# Altium project MicroMMC_SM_v3.PrjPcb
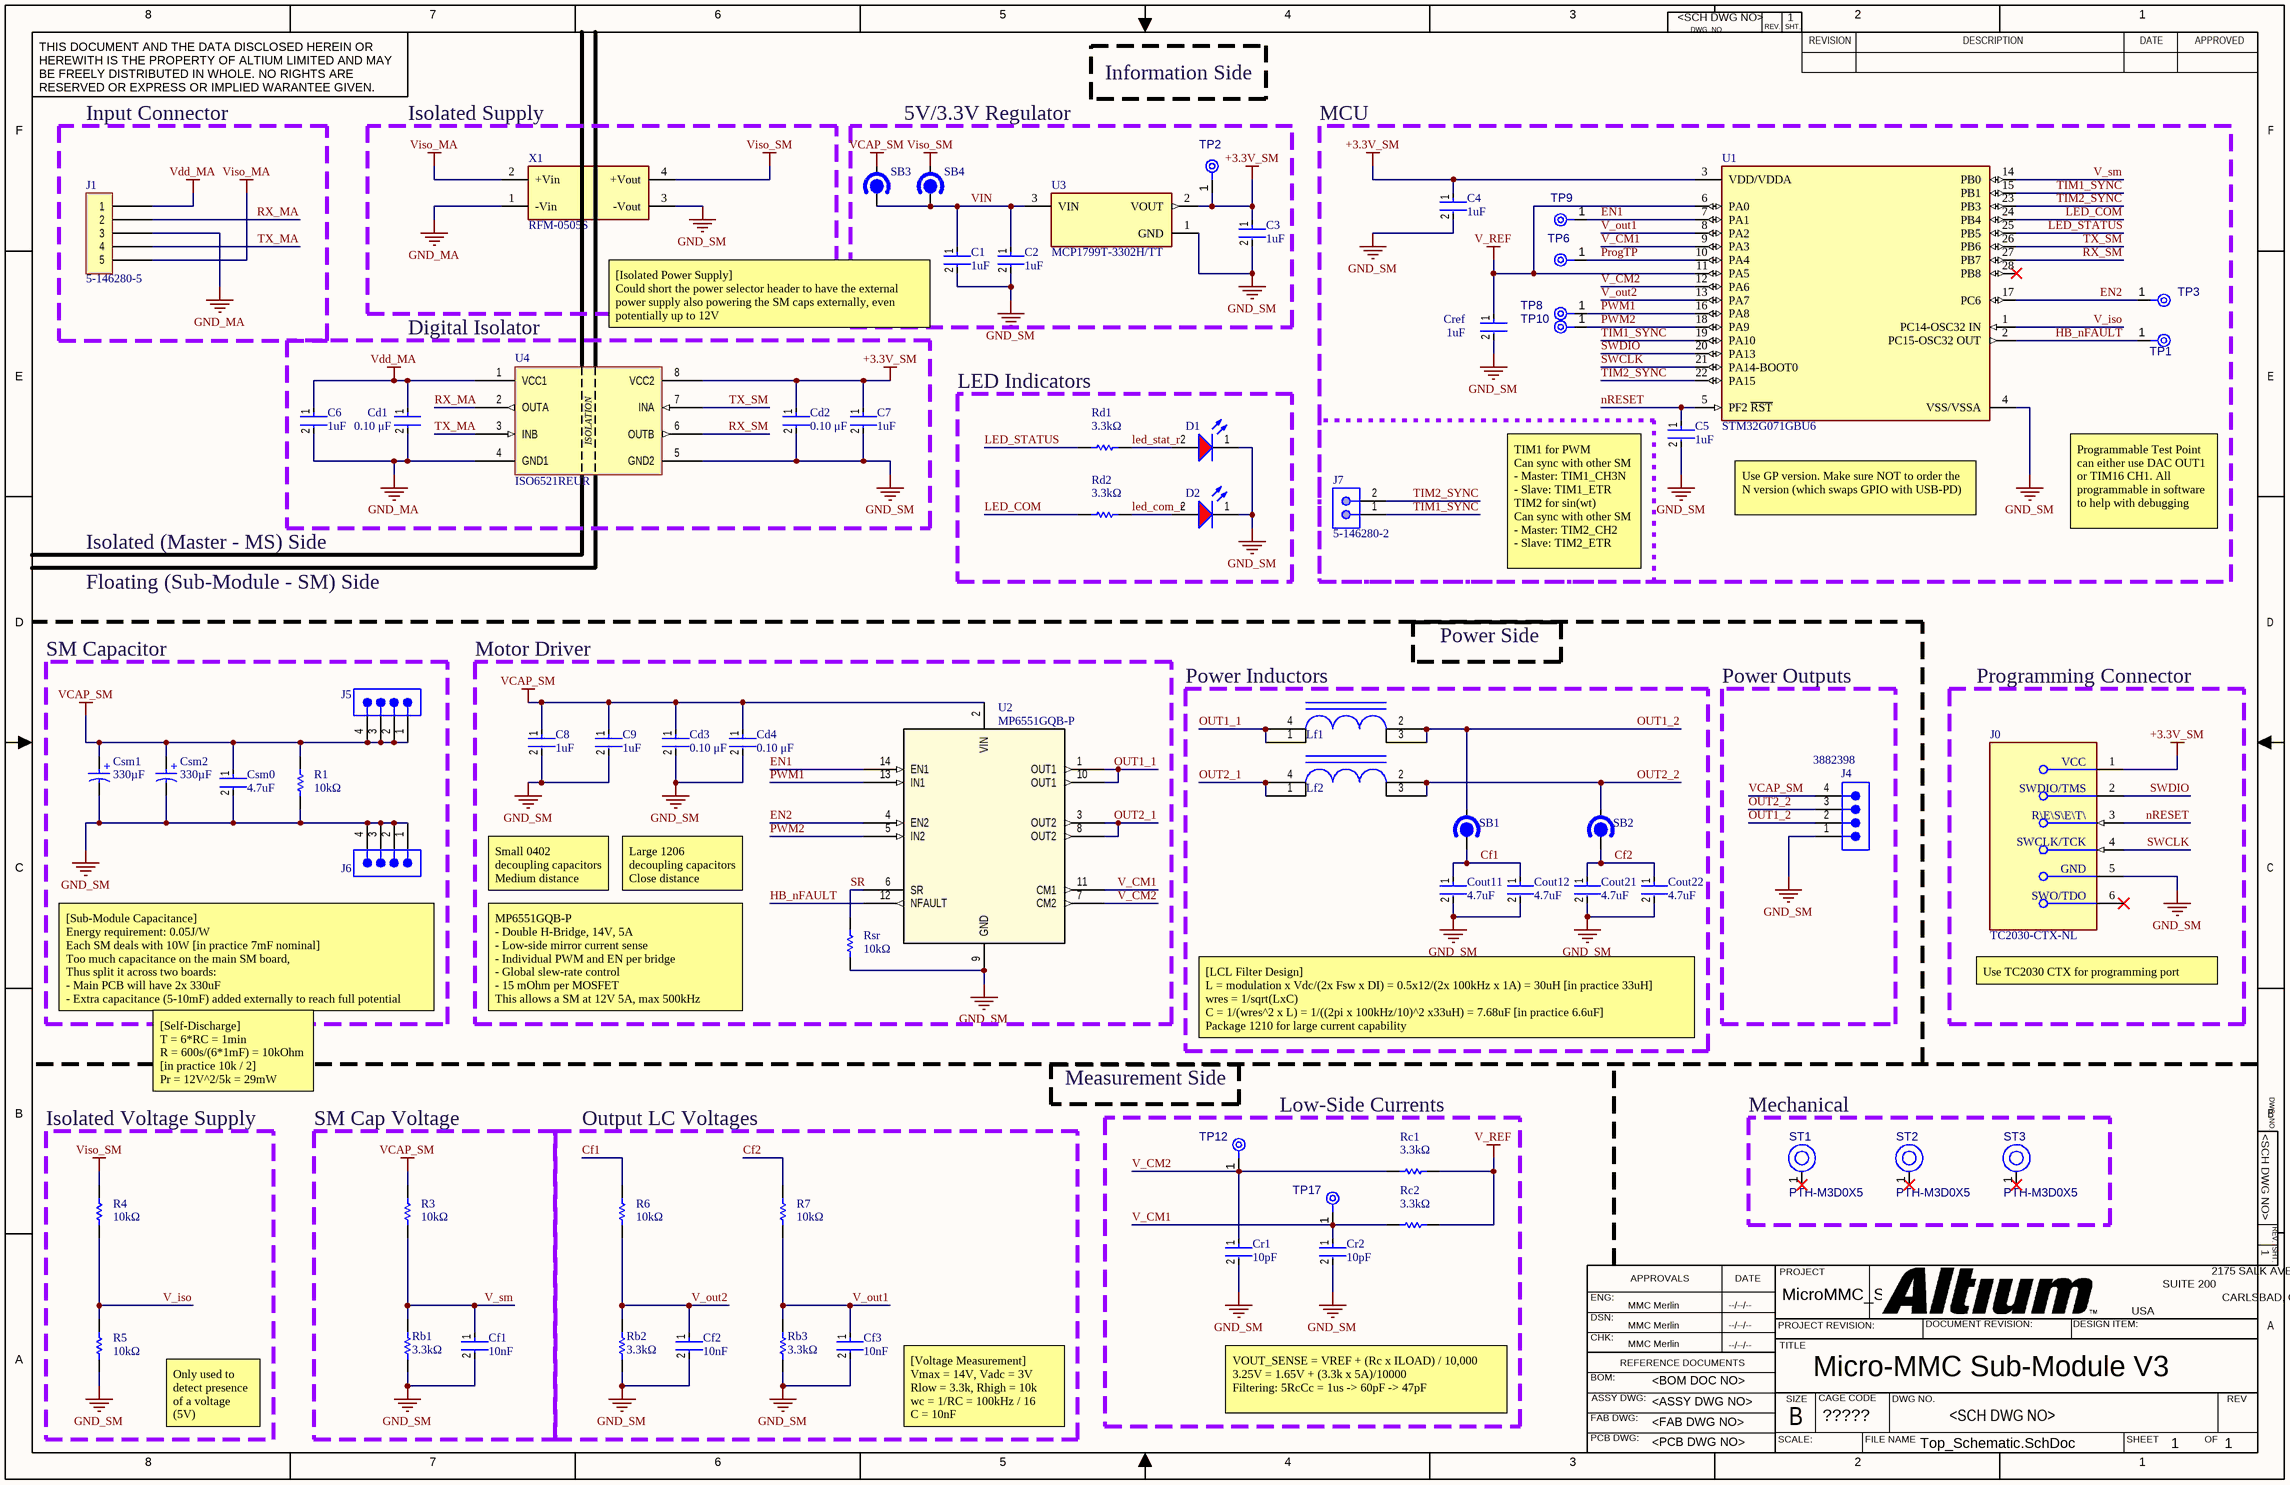
[diagram p0: Top_Schematic.SchDoc]
CAGE_CODE: ?????; CONTRACT_NUMBER: <CONTRACT NO>; DOC_NO_ASSY_DWG: <ASSY DWG NO>; DOC_NO_BOM: <BOM DOC NO>; DOC_NO_FAB_DWG: <FAB DWG NO>; DOC_NO_SCH_DWG: <SCH DWG NO>; PCB_2_DEC_TOL: +/-.01; PCB_3_DEC_TOL: +/-.010; PCB_ANG_TOL: +/-1/2; PCB_ASSEMBLY_NO: <PCB ASSY NO>; PCB_CHECKER: - -----; PCB_CHECKER_APP_DATE: --/--/----; PCB_DESIGNER: - -----; PCB_DESIGNER_APP_DATE: --/--/----; PCB_DWG_NO: <PCB DWG NO>; PCB_ENGINEER: - -----; PCB_ENGINEER_APP_DATE: --/--/----; PCB_PART_NUMBER: <PCB PN>; PCB_REV: A; SCH_REV: A
1 sheet, 71 parts. Net scope: global (net labels, ports and power ports of the same name join across sheets).
Board file: MicroMMC_SM_v3.PcbDoc

## Sheet Top_Schematic.SchDoc: Micro-MMC Sub-Module V3
size 431 x 279 mm; Date: 10/08/2023; ApprovedBy: MMC Merlin; CheckedBy: MMC Merlin; Author: MMC Merlin; CompanyName: University of Edinburgh; DrawnBy: MMC Merlin; Engineer: MMC Merlin; Organization: University of Edinburgh; Address1: School of Engineering; Address2: King's Buildings Campus; Address3: Edinburgh EH9 5FB; Address4: UK; DocumentNumber: 1; SheetNumber: 1; SheetTotal: 1; Project: MicroMMC_SM_V3; ENG_APP_DATE: --/--/--; DSN_APP_DATE: --/--/--; CHK_APP_DATE: --/--/--; SPICEModelCacheCJHNTGTK: <root> / <DocumentId>CJHNTGTK</DocumentId> / </root>; Time: 20:45

### Parts
C1  Capacitance: 1uF  [FP-GRM155-0_05-IPC_C]  (hidden comment: GRM155R61E105KA12D)
C2  Capacitance: 1uF  [FP-GRM155-0_05-IPC_C]  (hidden comment: GRM155R61E105KA12D)
C3  Capacitance: 1uF  [FP-GRM155-0_05-IPC_C]  (hidden comment: GRM155R61E105KA12D)
C4  Capacitance: 1uF  [FP-GRM155-0_05-IPC_C]  (hidden comment: GRM155R61E105KA12D)
C5  Capacitance: 1uF  [FP-GRM155-0_05-IPC_C]  (hidden comment: GRM155R61E105KA12D)
C6  Capacitance: 1uF  [FP-GRM155-0_05-IPC_C]  (hidden comment: GRM155R61E105KA12D)
C7  Capacitance: 1uF  [FP-GRM155-0_05-IPC_C]  (hidden comment: GRM155R61E105KA12D)
C8  Capacitance: 1uF  [FP-GRM155-0_05-IPC_C]  (hidden comment: GRM155R61E105KA12D)
C9  Capacitance: 1uF  [FP-GRM155-0_05-IPC_C]  (hidden comment: GRM155R61E105KA12D)
Cd1  Capacitance: 0.10 μF  [FP-C1206C-EB-MFG]  (hidden comment: C1206C104M5RACTU)
Cd2  Capacitance: 0.10 μF  [FP-C1206C-EB-MFG]  (hidden comment: C1206C104M5RACTU)
Cd3  Capacitance: 0.10 μF  [FP-C1206C-EB-MFG]  (hidden comment: C1206C104M5RACTU)
Cd4  Capacitance: 0.10 μF  [FP-C1206C-EB-MFG]  (hidden comment: C1206C104M5RACTU)
Cf1  Capacitance: 10nF  [FP-CL165-IPC_C]  (hidden comment: CL05B103KB5NNNC)
Cf2  Capacitance: 10nF  [FP-CL165-IPC_C]  (hidden comment: CL05B103KB5NNNC)
Cf3  Capacitance: 10nF  [FP-CL165-IPC_C]  (hidden comment: CL05B103KB5NNNC)
Cout11  Capacitance: 4.7uF  [FP-GRM21B-0_15-IPC_C]  (hidden comment: GRM21BR61H475ME51L)
Cout12  Capacitance: 4.7uF  [FP-GRM21B-0_15-IPC_C]  (hidden comment: GRM21BR61H475ME51L)
Cout21  Capacitance: 4.7uF  [FP-GRM21B-0_15-IPC_C]  (hidden comment: GRM21BR61H475ME51L)
Cout22  Capacitance: 4.7uF  [FP-GRM21B-0_15-IPC_C]  (hidden comment: GRM21BR61H475ME51L)
Cr1  Capacitance: 10pF  [FP-GJM155-0_05-MFG]  (hidden comment: GJM1555C1H100JB01D)
Cr2  Capacitance: 10pF  [FP-GJM155-0_05-MFG]  (hidden comment: GJM1555C1H100JB01D)
Cref  Capacitance: 1uF  [FP-GRM155-0_05-IPC_C]  (hidden comment: GRM155R61E105KA12D)
Csm0  Capacitance: 4.7uF  [FP-GRM21B-0_15-IPC_C]  (hidden comment: GRM21BR61H475ME51L)
Csm1  Capacitance: 330µF  [WCAP-ATG8_D8H11.5]  (hidden comment: 860010474012)
Csm2  Capacitance: 330µF  [WCAP-ATG8_D8H11.5]  (hidden comment: 860010474012)
D1  150060RS75000  [WL-SMCW_0603_150060xx75000]  (value not drawn)
D2  150060RS75000  [WL-SMCW_0603_150060xx75000]  (value not drawn)
J0  TC2030-CTX-NL  [FP-TC2030-CTX-NL-MFG]  (no BOM)
J1  5-146280-5  [5-146280-5]  (no BOM)
J4  Supplier Part Number 1: 3882398  [SMTC-TSW-104-08-X-S]  (hidden comment: TSW-104-08-L-S)  (no BOM)
J5  TSW-104-08-L-S  [SMTC-TSW-104-08-X-S]  (value not drawn)  (no BOM)
J6  TSW-104-08-L-S  [SMTC-TSW-104-08-X-S]  (value not drawn)  (no BOM)
J7  5-146280-2  [TECO-5-146280-2_V]  (no BOM)
Lf1  RCH1216BNP-100M  [TH Inductor]  (value not drawn)
Lf2  RCH1216BNP-100M  [TH Inductor]  (value not drawn)
R1  Resistance: 10kΩ  [RESC1005X40X25LL05T10]  (hidden comment: RC0402FR-0710KL)
R3  Resistance: 10kΩ  [RESC1005X40X25LL05T10]  (hidden comment: RC0402FR-0710KL)
R4  Resistance: 10kΩ  [RESC1005X40X25LL05T10]  (hidden comment: RC0402FR-0710KL)
R5  Resistance: 10kΩ  [RESC1005X40X25LL05T10]  (hidden comment: RC0402FR-0710KL)
R6  Resistance: 10kΩ  [RESC1005X40X25LL05T10]  (hidden comment: RC0402FR-0710KL)
R7  Resistance: 10kΩ  [RESC1005X40X25LL05T10]  (hidden comment: RC0402FR-0710KL)
Rb1  Resistance: 3.3kΩ  [RESC1005X40X25LL05T10]  (hidden comment: RC0402FR-073K3L)
Rb2  Resistance: 3.3kΩ  [RESC1005X40X25LL05T10]  (hidden comment: RC0402FR-073K3L)
Rb3  Resistance: 3.3kΩ  [RESC1005X40X25LL05T10]  (hidden comment: RC0402FR-073K3L)
Rc1  Resistance: 3.3kΩ  [RESC1005X40X25LL05T10]  (hidden comment: RC0402FR-073K3L)
Rc2  Resistance: 3.3kΩ  [RESC1005X40X25LL05T10]  (hidden comment: RC0402FR-073K3L)
Rd1  Resistance: 3.3kΩ  [RESC1005X40X25LL05T10]  (hidden comment: RC0402FR-073K3L)
Rd2  Resistance: 3.3kΩ  [RESC1005X40X25LL05T10]  (hidden comment: RC0402FR-073K3L)
Rsr  Resistance: 10kΩ  [RESC1005X40X25LL05T10]  (hidden comment: RC0402FR-0710KL)
SB1  Solder-Bridge-NO  [Solder-Bridge-NO-Footprint-1]  (value not drawn)  (no BOM)
SB2  Solder-Bridge-NO  [Solder-Bridge-NO-Footprint-1]  (value not drawn)  (no BOM)
SB3  Solder-Bridge-NO  [Solder-Bridge-NO-Footprint-1]  (value not drawn)  (no BOM)
SB4  Solder-Bridge-NO  [Solder-Bridge-NO-Footprint-1]  (value not drawn)  (no BOM)
ST1  PTH-M3D0X5  [PTH-M2D5X5]  (no BOM)
ST2  PTH-M3D0X5  [PTH-M2D5X5]  (no BOM)
ST3  PTH-M3D0X5  [PTH-M2D5X5]  (no BOM)
TP1  TPAD6R  [TP06R]  (value not drawn)  (no BOM)
TP2  TPAD6R  [TP06R]  (value not drawn)  (no BOM)
TP3  TPAD6R  [TP06R]  (value not drawn)  (no BOM)
TP6  TPAD6R  [TP06R]  (value not drawn)  (no BOM)
TP8  TPAD6R  [TP06R]  (value not drawn)  (no BOM)
TP9  TPAD6R  [TP06R]  (value not drawn)  (no BOM)
TP10  TPAD6R  [TP06R]  (value not drawn)  (no BOM)
TP12  TPAD6R  [TP06R]  (value not drawn)  (no BOM)
TP17  TPAD6R  [TP06R]  (value not drawn)  (no BOM)
U1  STM32G071GBU6  [FP-UFQFPN28-A0B0-MFG]
U2  MP6551GQB-P  [QFN-14_MP6551_MNP]
U3  MCP1799T-3302H/TT  [FP-C04-104-MFG]
U4  ISO6521REUR  [SON50P300X105-8N]
X1  RFM-0505S  [FP-RFM-0505S-MFG]

### Blocks framed on the sheet
Input Connector: J1
Isolated Supply: X1
5V/3.3V Regulator: C1-C3 SB3 SB4 TP2 U3
MCU: C4 C5 Cref J7 TP1 TP3 TP6 TP8-TP10 U1
Digital Isolator: C6 C7 Cd1 Cd2 U4
LED Indicators: D1 D2 Rd1 Rd2
SM Capacitor: Csm0-Csm2 J5 J6 R1
Motor Driver: C8 C9 Cd3 Cd4 Rsr U2
Power Inductors: Cout11 Cout12 Cout21 Cout22 Lf1 Lf2 SB1 SB2
Power Outputs: J4
Programming Connector: J0
Low-Side Currents: Cr1 Cr2 Rc1 Rc2 TP12 TP17
Mechanical: ST1-ST3
Isolated Voltage Supply: R4 R5
SM Cap Voltage: Cf1 R3 Rb1
Output LC Voltages: Cf2 Cf3 R6 R7 Rb2 Rb3

### Nets
+3.3V_SM: C3.1 C4.1 C7.1 Cd2.1 J0.1(VCC) TP2.1(TP) U1.3(VDD/VDDA) U3.2(VOUT) U4.8(VCC2)
GND_MA: C6.2 Cd1.2 J1.3 U4.4(GND1) X1.1(-Vin)
GND_SM: C1.2 C2.2 C3.2 C4.2 C5.2 C7.2 C8.2 C9.2 Cd2.2 Cd3.2 Cd4.2 Cf1.2 Cf2.2 Cf3.2 Cout11.2 Cout12.2 Cout21.2 Cout22.2 Cr1.2 Cr2.2 Cref.2 Csm0.2 Csm1.2(N) Csm2.2(N) D1.1(K) D2.1(K) J0.5(GND) J4.1 J6.1 J6.2 J6.3 J6.4 R1.1 R5.1 Rb1.1 Rb2.1 Rb3.1 Rsr.1 U1.4(VSS/VSSA) U2.9(GND) U3.1(GND) U4.5(GND2) X1.3(-Vout)
V_REF: Cref.1 Rc1.2 Rc2.2 U1.6(PA0) U1.11(PA5)
VCAP_SM: C8.1 C9.1 Cd3.1 Cd4.1 Csm0.1 Csm1.1(P) Csm2.1(P) J4.4 J5.1 J5.2 J5.3 J5.4 R1.2 R3.2 SB3.1 U2.2(VIN)
Vdd_MA: C6.1 Cd1.1 J1.1 U4.1(VCC1)
Viso_MA: J1.5 X1.2(+Vin)
Viso_SM: R4.2 SB4.1 X1.4(+Vout)
Cf1: Cout11.1 Cout12.1 R6.2 SB1.2
Cf2: Cout21.1 Cout22.1 R7.2 SB2.2
EN1: TP9.1(TP) U1.7(PA1) U2.14(EN1)
EN2: TP3.1(TP) U1.17(PC6) U2.4(EN2)
HB_nFAULT: TP1.1(TP) U1.2(PC15-OSC32_OUT) U2.12(NFAULT)
LED_COM: Rd2.1 U1.24(PB4)
led_com_r: D2.2(A) Rd2.2
led_stat_r: D1.2(A) Rd1.2
LED_STATUS: Rd1.1 U1.25(PB5)
nRESET: C5.1 J0.3(~{RESET}) U1.5(PF2_~{RST})
OUT1_1: Lf1.1 Lf1.4 U2.1(OUT1) U2.10(OUT1)
OUT1_2: J4.2 Lf1.2 Lf1.3 SB1.1
OUT2_1: Lf2.1 Lf2.4 U2.3(OUT2) U2.8(OUT2)
OUT2_2: J4.3 Lf2.2 Lf2.3 SB2.1
ProgTP: TP6.1(TP) U1.10(PA4)
PWM1: TP8.1(TP) U1.16(PA8) U2.13(IN1)
PWM2: TP10.1(TP) U1.18(PA9) U2.5(IN2)
RX_MA: J1.2 U4.2(OUTA)
RX_SM: U1.27(PB7) U4.6(OUTB)
SR: Rsr.2 U2.6(SR)
SWCLK: J0.4(SWCLK/TCK) U1.21(PA14-BOOT0)
SWDIO: J0.2(SWDIO/TMS) U1.20(PA13)
TIM1_SYNC: J7.1 U1.15(PB1) U1.19(PA10)
TIM2_SYNC: J7.2 U1.22(PA15) U1.23(PB3)
TX_MA: J1.4 U4.3(INB)
TX_SM: U1.26(PB6) U4.7(INA)
V_CM1: Cr2.1 Rc2.1 TP17.1(TP) U1.9(PA3) U2.11(CM1)
V_CM2: Cr1.1 Rc1.1 TP12.1(TP) U1.12(PA6) U2.7(CM2)
V_iso: R4.1 R5.2 U1.1(PC14-OSC32_IN)
V_out1: Cf3.1 R7.1 Rb3.2 U1.8(PA2)
V_out2: Cf2.1 R6.1 Rb2.2 U1.13(PA7)
V_sm: Cf1.1 R3.1 Rb1.2 U1.14(PB0)
VIN: C1.1 C2.1 SB3.2 SB4.2 U3.3(VIN)

Not connected (* = marked no-connect by the designer): J0 6(SWO/TDO)*; ST1 1(H1)*; ST2 1(H1)*; ST3 1(H1)*; U1 28(PB8)*

### Notes on the sheet
- Information Side
- (near C1) [Isolated Power Supply]
  Could short the power selector header to have the external power supply also powering the SM caps externally, even potentially up to 12V
- Isolated (Master - MS) Side
- (near C5) TIM1 for PWM
  Can sync with other SM
  - Master: TIM1_CH3N
  - Slave: TIM1_ETR
  TIM2 for sin(wt)
  Can sync with other SM
  - Master: TIM2_CH2
  - Slave: TIM2_ETR
- Use GP version. Make sure NOT to order the N version (which swaps GPIO with USB-PD)
- Programmable Test Point can either use DAC OUT1 or TIM16 CH1. All programmable in software to help with debugging
- Floating (Sub-Module - SM) Side
- Power Side
- Small 0402 decoupling capacitors
  Medium distance
- Large 1206 decoupling capacitors
  Close distance
- [Sub-Module Capacitance]
  Energy requirement: 0.05J/W
  Each SM deals with 10W [in practice 7mF nominal]
  Too much capacitance on the main SM board,
  Thus split it across two boards:
  - Main PCB will have 2x 330uF
  - Extra capacitance (5-10mF) added externally to reach full potential
- MP6551GQB-P
  - Double H-Bridge, 14V, 5A
  - Low-side mirror current sense
  - Individual PWM and EN per bridge
  - Global slew-rate control
  - 15 mOhm per MOSFET
  This allows a SM at 12V 5A, max 500kHz
- [LCL Filter Design]
  L = modulation x Vdc/(2x Fsw x DI) = 0.5x12/(2x 100kHz x 1A) = 30uH [in practice 33uH]
  wres = 1/sqrt(LxC)
  C = 1/(wres^2 x L) = 1/((2pi x 100kHz/10)^2 x33uH) = 7.68uF [in practice 6.6uF]
  Package 1210 for large current capability
- Use TC2030 CTX for programming port
  NOT MCP!!!
- [Self-Discharge]
  T = 6*RC = 1min
  R = 600s/(6*1mF) = 10kOhm [in practice 10k / 2]
  Pr = 12V^2/5k = 29mW
- Measurement Side
- Only used to detect presence of a voltage (5V)
- [Voltage Measurement]
  Vmax = 14V, Vadc = 3V
  Rlow = 3.3k, Rhigh = 10k
  wc = 1/RC = 100kHz / 16
  C = 10nF
- VOUT_SENSE = VREF + (Rc x ILOAD) / 10,000
  3.25V = 1.65V + (3.3k x 5A)/10000
  Filtering: 5RcCc = 1us -> 60pF -> 47pF
- 8
- 7
- 6
- 5
- 4
- 3
- DWG. NO.
- REV.
- SHT.
- 2
- 1
- THIS DOCUMENT AND THE DATA DISCLOSED HEREIN OR HEREWITH IS THE PROPERTY OF ALTIUM LIMITED AND MAY BE FREELY DISTRIBUTED IN WHOLE. NO RIGHTS ARE RESERVED OR EXPRESS OR IMPLIED WARANTEE GIVEN.
- REVISION
- DESCRIPTION
- DATE
- APPROVED
- F
- E
- D
- C
- B
- ENG:
- APPROVALS
- PROJECT
- SUITE 200
- 2175 SALK AVENUE
- CARLSBAD, CA 92008
- A
- DSN:
- CHK:
- REFERENCE DOCUMENTS
- PROJECT REVISION:
- TITLE
- DOCUMENT REVISION:
- DESIGN ITEM:
- USA
- BOM:
- FAB DWG:
- PCB DWG:
- ASSY DWG:
- SCALE:
- SIZE
- CAGE CODE
- FILE NAME
- DWG NO.
- SHEET
- OF
- REV
- (in symbol CMP-015-00010-3) ISOLATION
- (in symbol CMP-03913-54007214-1) +

### Library data of the parts
C1-C9 Cref = CMP-2008-04581-2: Chip Multilayer Ceramic Capacitors for General Purpose, 0402, 1.0uF, X5R, 15%, 10%, 25V; Height: 0.5mm; Voltage: 25V; Tolerance: 10%; Termination: SMD/SMT; Dielectric: X5R; REACH SVHC: No SVHC; Case Code (Imperial): 0402; Max Operating Temperature: 85°C; Lead Free: Lead Free; Case/Package: 0402; Mount: Surface Mount; Width: 0.5mm; Weight: 0.000212oz; Min Operating Temperature: -55°C; Voltage Rating (DC): 25V; Length: 1mm; Thickness: 0.022inch; Voltage Rating: 25V; Material: Ceramic; Case Code (Metric): 1005; Package Quantity: 10000; Packaging: Tape and Reel; Depth: 0.5mm; JLCPCB Part #: C52923
Cd1-Cd4 = CMP-03020-028488-1: CAP CER 0.1UF 50V X7R 1206; Manufacturer: KEMET; Automotive Grade: Grade 0; Value: 0.10 μF; Tolerance: 0.2; Temperature Coefficient: 15%; Material: Ceramic; Device Class L3: Ceramic Capacitors; Device Class L1: Passive Components; Category: Cap; Octopart: https://octopart.com/c1206c104m5ractu-kemet-129344; Temperature Range Low: -55°C; RoHS: TRUE; Manufacturer Part Number: C1206C104M5RACTU; Lead Free: Yes; Package: C1206C-EB; Digikey Description: CAP CER 0.1UF 50V X7R 1206; Automotive: Yes; Height: 0.88mm; Device Class L2: Capacitors; ComponentLink2Description: Datasheet; Mouser Description: Multilayer Ceramic Capacitors MLCC - SMD/SMT 50volts 0.1uF X7R 20%; Temperature: -55°C to +150°C; Temperature Characteristic: X7R; ComponentLink2URL: https://content.kemet.com/datasheets/KEM_C1007_X8R_ULTRA_150C_SMD.pdf; Ipc Land Pattern Name: CAPC320160X78; Temperature Range High: +150°C; Voltage Rating: 50 V; JLCPCB Part #: C24497
Cf1-Cf3 = CMP-13271-000387-1: Cap Ceramic 10nF 50V X7R ±10% SMD 0402 +125°C Paper T/R; Depth: 0.5mm; Length: 1mm; Lead Free: Lead Free; Case Code (Metric): 1005; Width: 0.02inch; Min Operating Temperature: -55°C; Thickness: 0.022inch; Package Quantity: 1; Mount: Surface Mount; Height: 0.5mm; Voltage: 50V; Material: Ceramic; Tolerance: 10%; Case Code (Imperial): 0402; Radiation Hardening: No; Case/Package: 0402; Max Operating Temperature: 125°C; Voltage Rating (DC): 50V; Contact Plating: Tin; Packaging: Tape and Reel; Voltage Rating: 50V; Dielectric: X7R; JLCPCB Part #: C15195
Cout11 Cout12 Cout21 Cout22 Csm0 = CMP-06035-037765-1: Chip Multilayer Ceramic Capacitors for General Purpose, 0805, 4.7uF, X5R, 15%, 20%, 50V; Resistor Type: Ceramic; Length: 2mm; Case/Package: 0805; Case Code (Metric): 2012; Width: 0.049inch; Case Code (Imperial): 0805; Voltage Rating (DC): 50V; Packaging: Tape and Reel; Mount: Surface Mount; Package Quantity: 3000; Voltage Rating: 50V; Termination: SMD/SMT; Height: 1.25mm; Tolerance: 20%; Max Operating Temperature: 85°C; Depth: 1.2mm; Min Operating Temperature: -55°C; Dielectric: X5R; Weight: 0.000335oz; Thickness: 0.055inch; JLCPCB Part #: C98192
Cr1 Cr2 = CMP-2008-03797-2: Multi-Layer Ceramic Capacitor 10pF C0G  ±5% 0402 Paper T/R; Voltage Rating (DC): 50V; Mount: Surface Mount; Width: 0.02inch; Height: 0.5mm; Termination: SMD/SMT; Packaging: Tape and Reel; Case Code (Metric): 1005; Depth: 0.5mm; Min Operating Temperature: -55°C; Case/Package: 0402; Voltage Rating: 50V; Tolerance: 5%; Lead Free: Lead Free; Package Quantity: 1; Case Code (Imperial): 0402; Radiation Hardening: No; Length: 1mm; Voltage: 50V; Dielectric: C0G; Thickness: 0.022inch; Max Operating Temperature: 125°C; JLCPCB Part #: C32949
Csm1 Csm2 = CMP-03913-54007214-1: 860010474012 WCAP-ATG8 Aluminum Electrolytic Capacitors; Manufacturer: Panasonic; Manufacturer Part Number: ECA-1CHG471; Pitch: 3.5mm; Life (Hours): 2000hours; Voltage Rating (DC): 25V; Polarity: Polar; Tolerance: 20%; Leakage Current: 82.5µA; Ripple Current: 451mA; Dielectric Material: Aluminium; Value: 470uF; Rated DC Voltage (URdc): 16V; Tan Delta: 0.2; Material: Aluminium; Diameter: 8mm; Min Operating Temperature: -40°C; Voltage Rating: 25V; NexarPartId: 54007214; Lead Pitch: 3.5052mm; Height - Seated (Max): 13.0048mm; Max Operating Temperature: 85°C; Length: 11.5mm; RoHS: Compliant; Mount: Through Hole; Height: 11.5mm; Packaging: Tape & Box (TB); REACH SVHC: Unknown; Case/Package: Radial; Supplier 1: Mouser; Supplier Part Number 1: 667-ECA-1CHG471; Category: Aluminum Electrolytic Capacitors; Stock 1: 3498; Pricing 1: 1=0.23, 10=0.168, 50=0.168, 100=0.132, 1000=0.127, 10000=0.114 (USD); Mounting Technology: Through Hole; Pins: 2; Package Shape: Cylindrical; Terminal Finish: Tin; JESD-609 Code: e3; Capacitor Type: Aluminium; Tolerance  (fill in as +-): 20%; Package Style: RadialMeter; Tolerance (fill in as +-): 20%; Termination: Wire; Terminal Pitch: 3.5mm; Reach SVHC Compliant: Yes; RoHS Compliant: Yes; ComponentLink1URL: https://datasheet.ciiva.com:443/pdfs/VipMasterIC/IC/PANA/PANA-S-A0009903858/PANA-S-A0009903858-1.pdf?src-supplier=IHS+Markit; ComponentLink1Description: https://datasheet.ciiva.com:443/pdfs/VipMasterIC/IC/PANA/PANA-S-A0009903858/PANA-S-A0009903858-1.pdf?src-supplier=IHS+Markit; ComponentLink2URL: https://datasheet.ciiva.com/11777/0900766b800301b8-11777772.pdf?src-supplier=Rs; ComponentLink2Description: https://datasheet.ciiva.com/11777/0900766b800301b8-11777772.pdf?src-supplier=Rs; ComponentLink3URL: https://datasheet.ciiva.com/16397/aba0000ce26-16397142.pdf?src-supplier=Future+Electronics; ComponentLink3Description: https://datasheet.ciiva.com/16397/aba0000ce26-16397142.pdf?src-supplier=Future+Electronics; ComponentLink4URL: https://datasheet.ciiva.com/2984/aba0000ce26-2984287.pdf?src-supplier=Avnet; ComponentLink4Description: https://datasheet.ciiva.com/2984/aba0000ce26-2984287.pdf?src-supplier=Avnet; ComponentLink5URL: https://datasheet.ciiva.com/15197/getdatasheetpartid-255238-15197877.pdf?src-supplier=Verical; ComponentLink5Description: https://datasheet.ciiva.com/15197/getdatasheetpartid-255238-15197877.pdf?src-supplier=Verical; ComponentLink6URL: https://datasheet.ciiva.com/46386/1903322-46386215.pdf?src-supplier=Element14; ComponentLink6Description: https://datasheet.ciiva.com/46386/1903322-46386215.pdf?src-supplier=Element14; ComponentLink7URL: https://datasheet.ciiva.com/30106/8aba0000ce26-30106396.pdf?src-supplier=Onlinecomponents.com; ComponentLink7Description: https://datasheet.ciiva.com/30106/8aba0000ce26-30106396.pdf?src-supplier=Onlinecomponents.com
D1 D2 = CMP-1426-00001-4: LED Low-Power Uni-Color Red 630nm 2V 2-Pin Chip 0603(1608Metric) T/R; Max Junction Temperature (Tj): 95°C; Dominant Wavelength: 625nm; Lens Style: Clear, Rectangular; Viewing Angle: 140°; Forward Current: 100mA; Max Reverse Voltage (DC): 5V; Luminous Intensity: 250mcd; Test Current: 20mA; Power Dissipation: 72mW; Max Operating Temperature: 85°C; Mount: Surface Mount; Height: 700µm; Packaging: Tape and Reel; REACH SVHC: Unknown; Case Code (Metric): 1608; Peak Wavelength: 630nm; Forward Voltage: 2V; Case/Package: 0603; Color: Red; RoHS: Compliant; Width: 800µm; Reverse Voltage: 5V; Min Operating Temperature: -40°C; Wavelength: 625nm; Case Code (Imperial): 0603; Length: 1.6mm; JLCPCB Part #: C2286
J0 = CMP-205963-000001-1: 6-Pin “No legs” TC2030 Plug-of-Nails™ Cable for use with ARM Cortex processors
J1 = CMP-002-00297-1: Board Connector, 5 Contact(s), 1 Row(s), Male, Straight, Solder Terminal; Mounting Technology: Board; Connector Type: BOARD CONNECTOR; RoHS Compliant: Yes
J4-J6 = CMP-1024-00358-1: 0.025" SQ Post Header, Through-hole, Vertical, -55 to 125 degC, 2.54 mm Pitch, 4-Pin, Male, RoHS; Manufacturer: Samtec; Manufacturer Part Number: G800W304018EU; Pitch: 2.54 mm; Connector Type: BOARD CONNECTOR; Option: General Purpose; Filter Feature: No; Number of Rows Loaded: 1; Number of Contacts: 4; PartNumber: TSW-104-08-L-S; RoHS: True; Temperature Range: -55 to 125 degC; PackageDescription: .025[0.64] SQ. Post Terminal Strip Assembly; Orientation: Vertical; ComponentLink2URL: http://www.samtec.com/documents/webfiles/pdf/TSW_TH.PDF; ComponentLink1Description: Manufacturer URL; ComponentLink2Description: Datasheet; PackageVersion: DM, 8/1988; ComponentLink3URL: http://www.samtec.com/documents/webfiles/cpdf/TSW-XXX-XX-XXX-X-XX-XXX-MKT.pdf; Mounting Technology: Through-hole; PackageReference: TSW-104-08-X-S; ComponentLink3Description: Package Specification; ComponentLink1URL: http://www.samtec.com; DatasheetVersion: F-214; Supplier 1: Farnell; Category: Connectors; Stock 1: 3007; Pricing 1: 100=0.039, 1000=0.034, 2500=0.033, 5000=0.032, 10000=0.03, 20000=0.028 (GBP); Contact Material: Brass; Contact Finish - Mating: GOLD OVER NICKEL (50); Contact Finish - Termination: Tin (Sn) - with Nickel (Ni) barrier; JESD-609 Code: e3; Contact Gender: Male; Mixed Contacts: No; Mounting Style: STRAIGHT; Termination: Solder; Terminal Pitch: 2.54mm; Flammability Rating: UL94 V-0; DIN Conformance: No; IEC Conformance: No; MIL Conformance: No; RoHS Compliant: Yes
  J5 J6: Supplier Part Number 1: 3882398
J7 = CMP-2000-07492-1: Male Header, Pitch 2.54 mm, 1 x 2 Position, Height 8.21 mm, Tail Length 3.05 mm, -65 to 105 degC, RoHS, Bulk; Manufacturer: TE Connectivity; Mating Connector Lock: No(Without); Number of Positions: 2; Pitch: 2.54mm; PCB Mounting Orientation: Vertical; Keyed: No; Case\/Package: 100; Mating Post Length: 0.23inch; High Temperature Housing: Yes; Max Current Rating: 5A; PCB Thickness: 0.063inch; PCB Mount Retention: Without; Approvals: CSA; Current Rating: 3A; Radiation Hardening: No; Length: 4.67mm; Contact Mating Length: 0.23inch; Connector Type: Header; Number of Rows: 1; Termination Post Length: 0.12inch; Board Standoff: No(Without); Max Operating Temperature: 105degC; Contact Shape: Square; Selectively Loaded: No(Without); Gasket: No(Without); Number of Contacts: 2; Contact Gender: Male; Mating Alignment: No(Without); Manufacturer URL: http://www.te.com/; Datasheet URL: http://www.te.com/commerce/DocumentDelivery/DDEController?Action=showdoc&DocId=Customer+Drawing%7F146280%7FH1%7Fpdf%7FEnglish%7FENG_CD_146280_H1.pdf%7F5-146280-2; Mount: ThroughHole; Orientation: Straight; Packaging: Carton; Package Reference: 5-146280-2; Package Quantity: 500; Stabilizers: No(Without); Row Spacing: 2.54mm; Contact Material: CopperAlloy; Panel Mount Retention: No(Without); Datasheet Version: Rev. H1, 08/2016; Housing Colour: Black; Colour: Black; Package Description: Male Header, Pitch 2.54 mm, 1 x 2 Position, Height 8.21 mm, Tail Length 3.05 mm; Contact Plating: Matte; Housing Material: Polymer; Contact Protection: No(Without); Min Operating Temperature: -65degC; Mounting Technology: ThroughHole; Flammability Rating: UL94V-0; RoHSCompliant: true; Termination: ThroughHole; Depth: 2.34mm; High Speed Serial Data Connector: No
Lf1 Lf2 = CMP-006-00026-4: Ind Power Unshielded Wirewound 10uH 20% 1KHz Ferrite 5A Pin Box
R1 R3-R7 Rsr = CMP-2002-07353-1: Manufacturer: Yageo / Phycomp; Part Number: RC0402FR-0710KL; JLCPCB Part #: C25744
Rb1-Rb3 Rc1 Rc2 Rd1 Rd2 = CMP-2002-07652-1: 3.3k; Manufacturer: Yageo / Phycomp; Part Number: RC0402FR-073K3L; JLCPCB Part #: C25890
SB1-SB4 = CMP-00030-00003-3: Normally Open Solder Bridge 10mil gap
ST1-ST3 = CMP-00028-00004-1: M3.0 PTH (3.0mm), 5mm pad; Pins: 1
TP1-TP3 TP6 TP8-TP10 TP12 TP17 = CMP-00028-00002-1: 0.6mm round; Pins: 1
U1 = CMP-12105-000098-1: IC MCU 32BIT 128KB FLSH 28UFQFPN; Frequency: 64MHz; Interface: I2C; Core Architecture: ARM; Memory Type: FLASH; Peripherals: Brown-out Detect/Reset; Oscillator Type: Internal; Number of I/Os: 26; Min Operating Temperature: -40°C; Number of Pins: 28; Memory Size: 128KB; Max Operating Temperature: 85°C; Packaging: Tray; Case/Package: UFQFPN; RoHS Compliant: Yes; JLCPCB Part #: C529347
U2 = CMP-024-00000-3: Brushed DC Motor Driver Dual Half-Bridge PWM 2.5V to 14V 5A 14-Pin QFN; JLCPCB Part #: C3681210
U3 = CMP-06324-000112-1: IC REG LINEAR 3.3V 80MA SOT23-3; JLCPCB Part #: C7424770
U4 = CMP-015-00010-3: Functional isolation dual-channel 1/1 digital isolator 8-VSON -40 to 125; JLCPCB Part #: C22428095
X1 = CMP-29842-000017-1: DC DC CONVERTER 5V 1W; Height: 10mm; Width: 6mm; Max Output Voltage: 5V; Length: 11.5mm; Weight: 1.4g